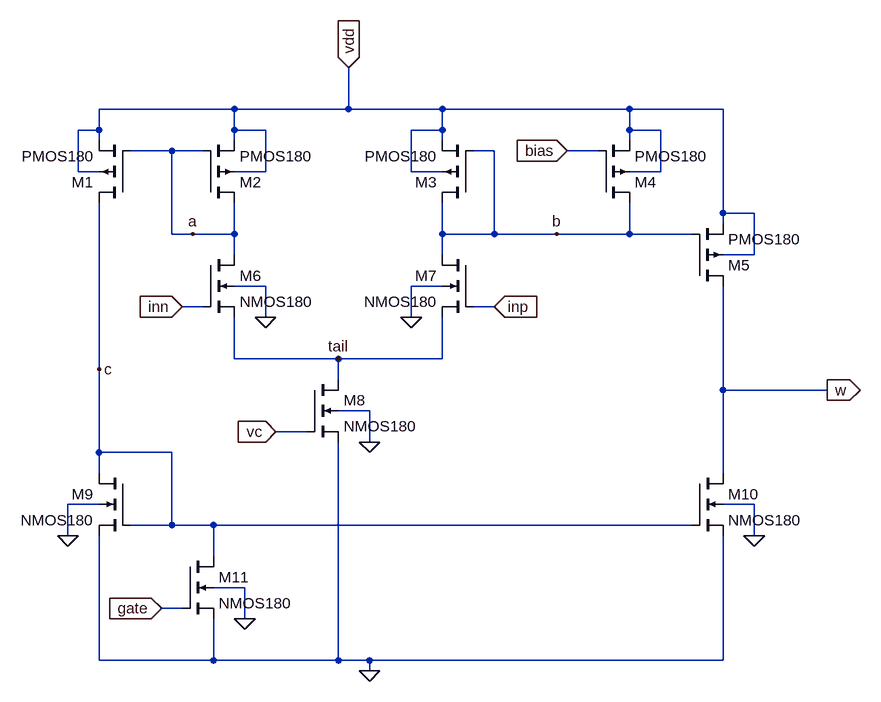
[diagram p0: schematic OTA.asc]
OTA.asc, the LTspice schematic file:
Version 4
SHEET 1 1200 788
WIRE 208 -96 0 -96
WIRE 384 -96 384 -160
WIRE 384 -96 208 -96
WIRE 528 -96 384 -96
WIRE 816 -96 528 -96
WIRE 960 -96 816 -96
WIRE 0 -64 0 -96
WIRE 0 -64 -32 -64
WIRE 208 -64 208 -96
WIRE 256 -64 208 -64
WIRE 528 -64 528 -96
WIRE 528 -64 480 -64
WIRE 816 -64 816 -96
WIRE 864 -64 816 -64
WIRE 0 -48 0 -64
WIRE 208 -48 208 -64
WIRE 528 -48 528 -64
WIRE 816 -48 816 -64
WIRE 112 -32 48 -32
WIRE 160 -32 112 -32
WIRE 608 -32 576 -32
WIRE 768 -32 720 -32
WIRE -32 0 -32 -64
WIRE 0 0 -32 0
WIRE 256 0 256 -64
WIRE 256 0 208 0
WIRE 480 0 480 -64
WIRE 528 0 480 0
WIRE 864 0 864 -64
WIRE 864 0 816 0
WIRE 960 64 960 -96
WIRE 1008 64 960 64
WIRE 960 80 960 64
WIRE 112 96 112 -32
WIRE 144 96 112 96
WIRE 208 96 208 48
WIRE 208 96 144 96
WIRE 528 96 528 48
WIRE 608 96 608 -32
WIRE 608 96 528 96
WIRE 704 96 608 96
WIRE 816 96 816 48
WIRE 816 96 704 96
WIRE 912 96 816 96
WIRE 208 128 208 96
WIRE 528 128 528 96
WIRE 1008 128 1008 64
WIRE 1008 128 960 128
WIRE 256 176 208 176
WIRE 528 176 480 176
WIRE 160 208 128 208
WIRE 608 208 576 208
WIRE 256 224 256 176
WIRE 480 224 480 176
WIRE 208 288 208 224
WIRE 368 288 208 288
WIRE 528 288 528 224
WIRE 528 288 368 288
WIRE 0 304 0 48
WIRE 368 320 368 288
WIRE 960 336 960 176
WIRE 1120 336 960 336
WIRE 416 368 368 368
WIRE 320 400 272 400
WIRE 416 416 416 368
WIRE 0 432 0 304
WIRE 112 432 0 432
WIRE 0 464 0 432
WIRE 960 464 960 336
WIRE 0 512 -48 512
WIRE 1008 512 960 512
WIRE 112 544 112 432
WIRE 112 544 48 544
WIRE 176 544 112 544
WIRE 912 544 176 544
WIRE -48 560 -48 512
WIRE 1008 560 1008 512
WIRE 176 592 176 544
WIRE 224 640 176 640
WIRE 128 672 96 672
WIRE 224 688 224 640
WIRE 0 752 0 560
WIRE 176 752 176 688
WIRE 176 752 0 752
WIRE 368 752 368 416
WIRE 368 752 176 752
WIRE 416 752 368 752
WIRE 960 752 960 560
WIRE 960 752 416 752
WIRE 416 768 416 752
FLAG -48 560 0
FLAG 256 224 0
FLAG 480 224 0
FLAG 416 416 0
FLAG 1008 560 0
FLAG 224 688 0
FLAG 384 -160 vdd
IOPIN 384 -160 In
FLAG 144 96 a
FLAG 704 96 b
FLAG 368 288 tail
FLAG 416 768 0
FLAG 96 672 gate
IOPIN 96 672 In
FLAG 0 304 c
FLAG 128 208 inn
IOPIN 128 208 In
FLAG 272 400 vc
IOPIN 272 400 In
FLAG 608 208 inp
IOPIN 608 208 In
FLAG 720 -32 bias
IOPIN 720 -32 In
FLAG 1120 336 w
IOPIN 1120 336 Out
SYMBOL nmos4 48 464 M0
SYMATTR InstName M9
SYMATTR Value NMOS180
SYMATTR Value2 l={LN} w={WN}
SYMBOL pmos4 160 48 M180
SYMATTR InstName M2
SYMATTR Value PMOS180
SYMATTR Value2 l={LP} w={WP}
SYMBOL pmos4 48 48 R180
SYMATTR InstName M1
SYMATTR Value PMOS180
SYMATTR Value2 l={LP} w={WP}
SYMBOL nmos4 160 128 R0
SYMATTR InstName M6
SYMATTR Value NMOS180
SYMATTR Value2 l={LN} w={WN}
SYMBOL pmos4 576 48 R180
SYMATTR InstName M3
SYMATTR Value PMOS180
SYMATTR Value2 l={LP} w={WP}
SYMBOL pmos4 768 48 M180
SYMATTR InstName M4
SYMATTR Value PMOS180
SYMATTR Value2 l={LP} w={WP}
SYMBOL pmos4 912 176 M180
SYMATTR InstName M5
SYMATTR Value PMOS180
SYMATTR Value2 l={LP} w={WP}
SYMBOL nmos4 576 128 M0
SYMATTR InstName M7
SYMATTR Value NMOS180
SYMATTR Value2 l={LN} w={WN}
SYMBOL nmos4 320 320 R0
SYMATTR InstName M8
SYMATTR Value NMOS180
SYMATTR Value2 l={LN} w={WN}
SYMBOL nmos4 912 464 R0
SYMATTR InstName M10
SYMATTR Value NMOS180
SYMATTR Value2 l={LN} w={WN}
SYMBOL nmos4 128 592 R0
SYMATTR InstName M11
SYMATTR Value NMOS180
SYMATTR Value2 l={LN} w={WN}

The netlist it stands for:
* OTA.asc
M9 c c 0 0 NMOS180 l={LN} w={WN}
M2 a a vdd vdd PMOS180 l={LP} w={WP}
M1 c a vdd vdd PMOS180 l={LP} w={WP}
M6 a inn tail 0 NMOS180 l={LN} w={WN}
M3 b b vdd vdd PMOS180 l={LP} w={WP}
M4 b bias vdd vdd PMOS180 l={LP} w={WP}
M5 w b vdd vdd PMOS180 l={LP} w={WP}
M7 b inp tail 0 NMOS180 l={LN} w={WN}
M8 tail vc 0 0 NMOS180 l={LN} w={WN}
M10 w c 0 0 NMOS180 l={LN} w={WN}
M11 c gate 0 0 NMOS180 l={LN} w={WN}
.model NMOS NMOS
.model PMOS PMOS
.lib standard.mos
.backanno
.end